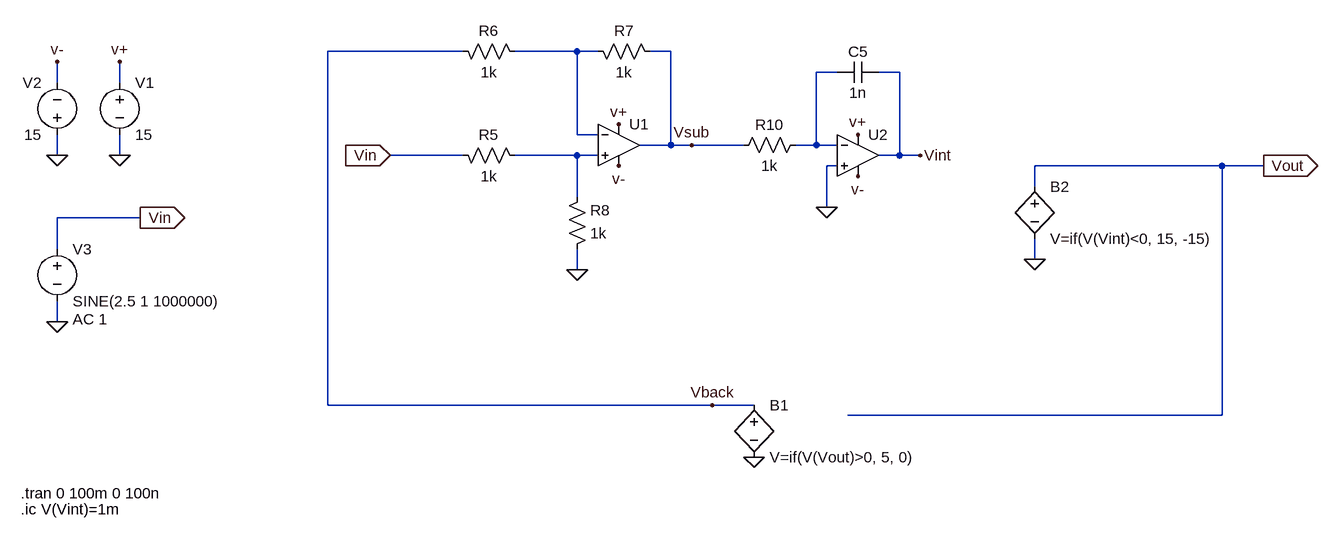
[diagram p0: schematic ltspice_behav_sigma_delta_mod.asc]
ltspice_behav_sigma_delta_mod.asc, the LTspice schematic file:
Version 4
SHEET 1 3200 1796
WIRE -176 1056 -384 1056
WIRE 0 1056 -96 1056
WIRE 32 1056 0 1056
WIRE 144 1056 112 1056
WIRE 400 1088 368 1088
WIRE 496 1088 464 1088
WIRE -800 1104 -800 1072
WIRE -704 1104 -704 1072
WIRE 0 1184 0 1056
WIRE 32 1184 0 1184
WIRE 144 1200 144 1056
WIRE 144 1200 96 1200
WIRE 176 1200 144 1200
WIRE 256 1200 176 1200
WIRE 368 1200 368 1088
WIRE 368 1200 336 1200
WIRE 400 1200 368 1200
WIRE -800 1216 -800 1184
WIRE -704 1216 -704 1184
WIRE -176 1216 -288 1216
WIRE 0 1216 -96 1216
WIRE 32 1216 0 1216
WIRE 496 1216 496 1088
WIRE 496 1216 464 1216
WIRE 528 1216 496 1216
WIRE 400 1232 384 1232
WIRE 992 1232 704 1232
WIRE 1056 1232 992 1232
WIRE 704 1264 704 1232
WIRE 0 1280 0 1216
WIRE 384 1296 384 1232
WIRE -672 1312 -800 1312
WIRE -800 1360 -800 1312
WIRE 704 1376 704 1344
WIRE 0 1392 0 1360
WIRE -800 1472 -800 1440
WIRE -384 1600 -384 1056
WIRE 208 1600 -384 1600
WIRE 272 1600 208 1600
WIRE 992 1616 992 1232
WIRE 992 1616 416 1616
FLAG -704 1072 v+
FLAG -800 1072 v-
FLAG -800 1216 0
FLAG -704 1216 0
FLAG -672 1312 Vin
IOPIN -672 1312 Out
FLAG -800 1472 0
FLAG -288 1216 Vin
IOPIN -288 1216 In
FLAG 0 1392 0
FLAG 64 1168 v+
FLAG 64 1232 v-
FLAG 432 1184 v+
FLAG 432 1248 v-
FLAG 384 1296 0
FLAG 1056 1232 Vout
IOPIN 1056 1232 Out
FLAG 528 1216 Vint
FLAG 176 1200 Vsub
FLAG 208 1600 Vback
FLAG 272 1680 0
FLAG 704 1376 0
SYMBOL voltage -704 1088 R0
SYMATTR InstName V1
SYMATTR Value 15
SYMBOL voltage -800 1200 R180
WINDOW 0 24 96 Left 2
WINDOW 3 24 16 Left 2
SYMATTR InstName V2
SYMATTR Value 15
SYMBOL voltage -800 1344 R0
WINDOW 123 24 124 Left 2
WINDOW 39 0 0 Left 0
SYMATTR Value2 AC 1
SYMATTR InstName V3
SYMATTR Value SINE(2.5 1 1000000)
SYMBOL res -80 1232 M270
WINDOW 0 32 56 VTop 2
WINDOW 3 0 56 VBottom 2
SYMATTR InstName R5
SYMATTR Value 1k
SYMBOL res -80 1072 M270
WINDOW 0 32 56 VTop 2
WINDOW 3 0 56 VBottom 2
SYMATTR InstName R6
SYMATTR Value 1k
SYMBOL res 128 1072 M270
WINDOW 0 32 56 VTop 2
WINDOW 3 0 56 VBottom 2
SYMATTR InstName R7
SYMATTR Value 1k
SYMBOL res -16 1376 M180
WINDOW 0 36 76 Left 2
WINDOW 3 36 40 Left 2
SYMATTR InstName R8
SYMATTR Value 1k
SYMBOL res 352 1184 R90
WINDOW 0 0 56 VBottom 2
WINDOW 3 32 56 VTop 2
SYMATTR InstName R10
SYMATTR Value 1k
SYMBOL cap 464 1072 R90
WINDOW 0 0 32 VBottom 2
WINDOW 3 32 32 VTop 2
SYMATTR InstName C5
SYMATTR Value 1n
SYMBOL OpAmps\\UniversalOpAmp2 64 1200 R0
SYMATTR InstName U1
SYMBOL OpAmps\\UniversalOpAmp2 432 1216 R0
SYMATTR InstName U2
SYMBOL bv 272 1584 R0
SYMATTR InstName B1
SYMATTR Value V=if(V(Vout)>0, 5, 0)
SYMBOL bv 704 1248 R0
SYMATTR InstName B2
SYMATTR Value V=if(V(Vint)<0, 15, -15)
TEXT -856 1736 Left 2 !.tran 0 100m 0 100n
TEXT -856 1760 Left 2 !.ic V(Vint)=1m

The netlist it stands for:
* ltspice_behav_sigma_delta_mod.asc
V1 v+ 0 15
V2 0 v- 15
V3 Vin 0 SINE(2.5 1 1000000) AC 1
R5 N003 Vin 1k
R6 N001 Vback 1k
R7 Vsub N001 1k
R8 0 N003 1k
R10 N002 Vsub 1k
C5 Vint N002 1n
XU1 N003 N001 v+ v- Vsub level2 Avol=1Meg GBW=10Meg Slew=10Meg Ilimit=25m Rail=0 Vos=0 En=0 Enk=0 In=0 Ink=0 Rin=500Meg  ; pins In+ In- V+ V- OUT
XU2 0 N002 v+ v- Vint level2 Avol=1Meg GBW=10Meg Slew=10Meg Ilimit=25m Rail=0 Vos=0 En=0 Enk=0 In=0 Ink=0 Rin=500Meg  ; pins In+ In- V+ V- OUT
B1 Vback 0 V=if(V(Vout)>0, 5, 0)
B2 Vout 0 V=if(V(Vint)<0, 15, -15)
.tran 0 100m 0 100n
.ic V(Vint)=1m
.lib UniversalOpAmp2.lib
.backanno
.end